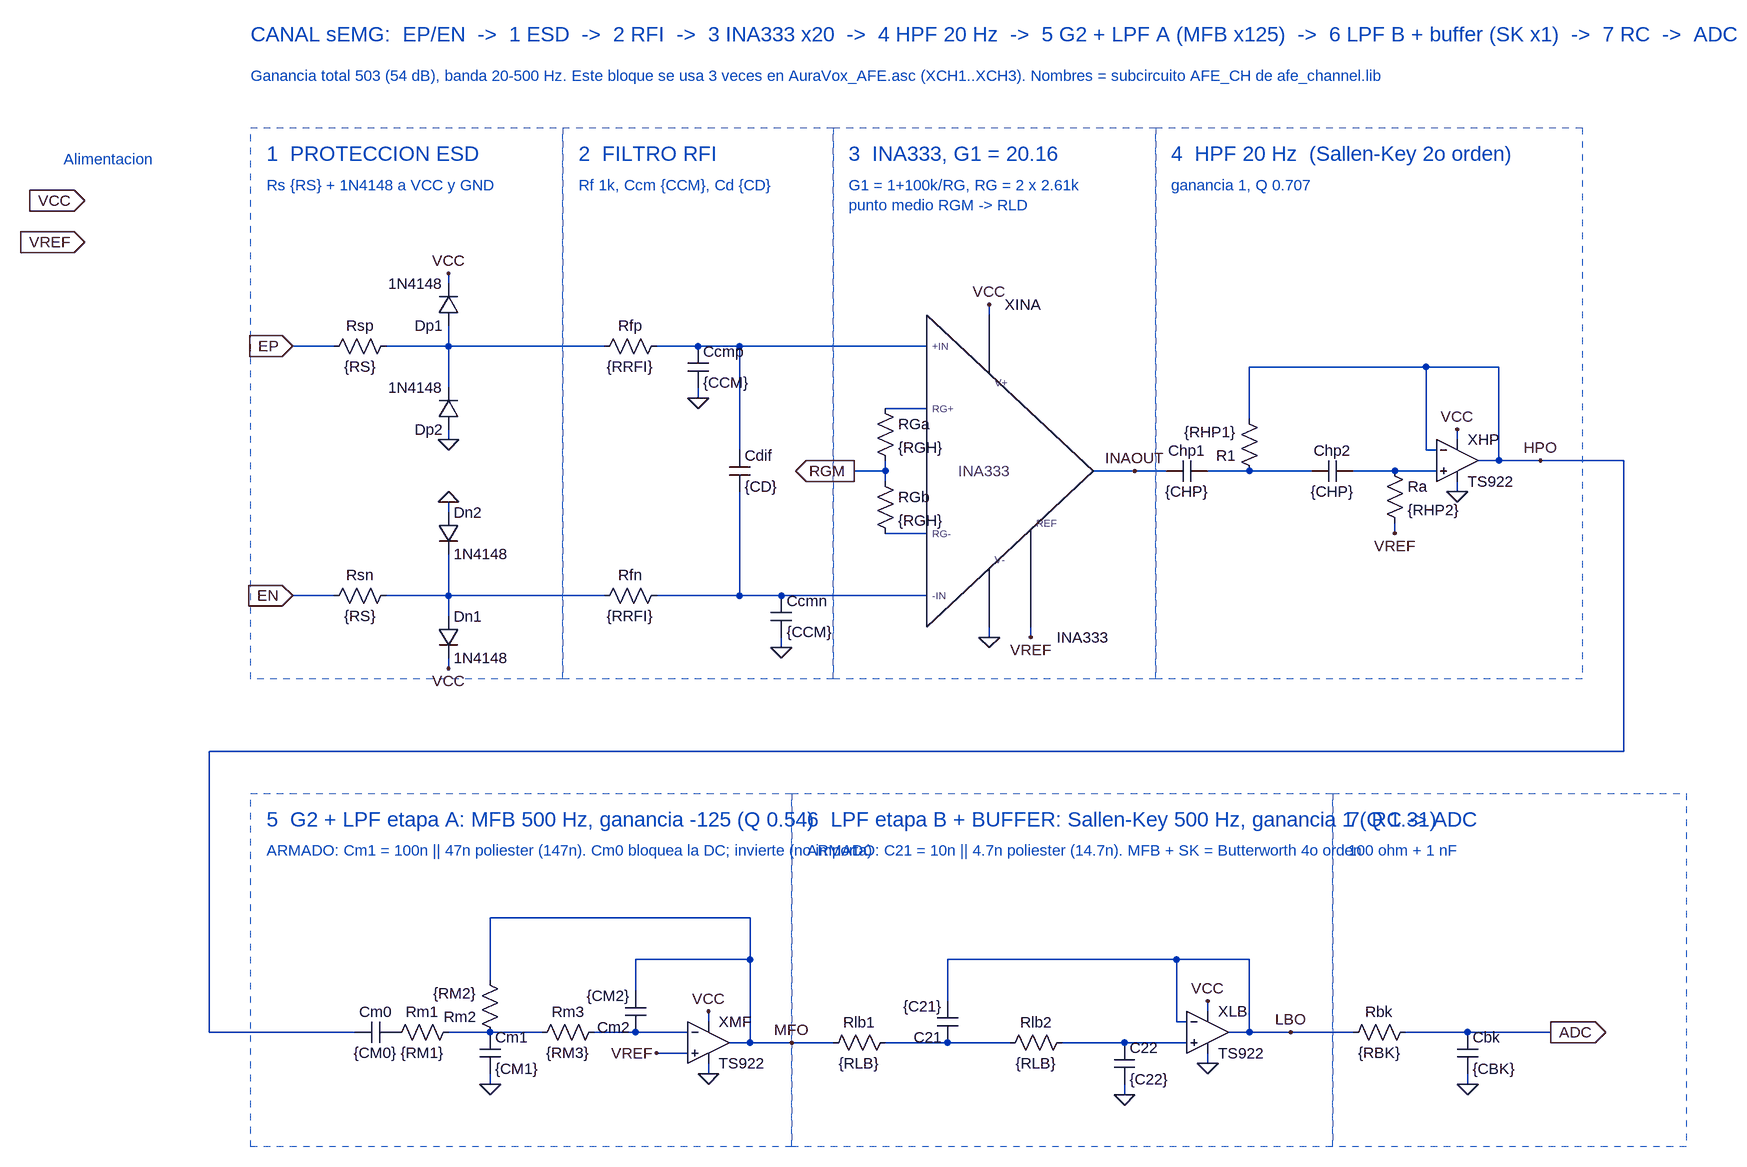
[diagram p0: schematic CANAL.asc]
CANAL.asc, the LTspice schematic file:
Version 4
SHEET 1 3000 1300
WIRE 32 0 -32 0
WIRE 112 0 208 0
WIRE 208 0 448 0
WIRE 32 384 -32 384
WIRE 112 384 208 384
WIRE 208 384 448 384
WIRE 208 0 208 -32
WIRE 208 -96 208 -112
WIRE 208 0 208 64
WIRE 208 128 208 144
WIRE 208 384 208 416
WIRE 208 480 208 496
WIRE 208 320 208 384
WIRE 208 256 208 240
WIRE 528 0 592 0
WIRE 592 0 656 0
WIRE 656 0 720 0
WIRE 720 0 944 0
WIRE 528 384 592 384
WIRE 592 384 656 384
WIRE 656 384 720 384
WIRE 720 384 944 384
WIRE 592 64 592 80
WIRE 656 0 656 160
WIRE 656 224 656 384
WIRE 720 448 720 464
WIRE 944 96 880 96
WIRE 880 176 880 192
WIRE 880 192 880 208
WIRE 880 288 944 288
WIRE 880 192 832 192
WIRE 1040 -48 1040 -64
WIRE 1040 432 1040 448
WIRE 1104 432 1104 448
WIRE 1200 192 1264 192
WIRE 1264 192 1312 192
WIRE 1376 192 1440 192
WIRE 1440 192 1536 192
WIRE 1600 192 1664 192
WIRE 1664 192 1728 192
WIRE 1664 272 1664 288
WIRE 1760 144 1760 128
WIRE 1760 208 1760 224
WIRE 1440 112 1440 32
WIRE 1440 32 1824 32
WIRE 1824 32 1824 176
WIRE 1728 160 1712 160
WIRE 1712 160 1712 32
WIRE 1792 176 1824 176
WIRE 1824 176 1888 176
WIRE 1888 176 2016 176
WIRE 2016 176 2016 624
WIRE 2016 624 -160 624
WIRE -160 624 -160 1056
WIRE -160 1056 64 1056
WIRE 208 1056 272 1056
WIRE 272 1056 352 1056
WIRE 272 1120 272 1136
WIRE 272 976 272 880
WIRE 272 880 672 880
WIRE 432 1056 496 1056
WIRE 496 1056 576 1056
WIRE 496 992 496 944
WIRE 496 944 672 944
WIRE 608 1040 608 1024
WIRE 608 1104 608 1120
WIRE 576 1088 528 1088
WIRE 672 880 672 944
WIRE 672 944 672 1072
WIRE 640 1072 672 1072
WIRE 672 1072 736 1072
WIRE 736 1072 800 1072
WIRE 880 1072 976 1072
WIRE 976 1072 1072 1072
WIRE 1152 1072 1248 1072
WIRE 1248 1072 1344 1072
WIRE 1248 1136 1248 1152
WIRE 1376 1024 1376 1008
WIRE 1376 1088 1376 1104
WIRE 976 1008 976 944
WIRE 976 944 1440 944
WIRE 1440 944 1440 1056
WIRE 1344 1040 1328 1040
WIRE 1328 1040 1328 944
WIRE 1408 1056 1440 1056
WIRE 1440 1056 1504 1056
WIRE 1504 1056 1600 1056
WIRE 1680 1056 1776 1056
WIRE 1776 1056 1904 1056
WIRE 1776 1120 1776 1136
FLAG -352 -224 VCC
IOPIN -352 -224 In
FLAG -352 -160 VREF
IOPIN -352 -160 In
FLAG -32 0 EP
IOPIN -32 0 In
FLAG -32 384 EN
IOPIN -32 384 In
FLAG 208 -112 VCC
FLAG 208 144 0
FLAG 208 496 VCC
FLAG 208 240 0
FLAG 592 80 0
FLAG 720 464 0
FLAG 832 192 RGM
IOPIN 832 192 Out
FLAG 1040 -64 VCC
FLAG 1040 448 0
FLAG 1104 448 VREF
FLAG 1264 192 INAOUT
FLAG 1664 288 VREF
FLAG 1760 128 VCC
FLAG 1760 224 0
FLAG 1888 176 HPO
FLAG 272 1136 0
FLAG 608 1024 VCC
FLAG 608 1120 0
FLAG 528 1088 VREF
FLAG 736 1072 MFO
FLAG 1248 1152 0
FLAG 1376 1008 VCC
FLAG 1376 1104 0
FLAG 1504 1056 LBO
FLAG 1776 1136 0
FLAG 1904 1056 ADC
IOPIN 1904 1056 Out
SYMBOL res 16 16 R270
WINDOW 0 32 56 VTop 2
WINDOW 3 0 56 VBottom 2
SYMATTR InstName Rsp
SYMATTR Value {RS}
SYMBOL res 16 400 R270
WINDOW 0 32 56 VTop 2
WINDOW 3 0 56 VBottom 2
SYMATTR InstName Rsn
SYMATTR Value {RS}
SYMBOL diode 224 -32 R180
SYMATTR InstName Dp1
SYMATTR Value 1N4148
SYMBOL diode 224 128 R180
SYMATTR InstName Dp2
SYMATTR Value 1N4148
SYMBOL diode 192 416 R0
SYMATTR InstName Dn1
SYMATTR Value 1N4148
SYMBOL diode 192 256 R0
SYMATTR InstName Dn2
SYMATTR Value 1N4148
SYMBOL res 432 16 R270
WINDOW 0 32 56 VTop 2
WINDOW 3 0 56 VBottom 2
SYMATTR InstName Rfp
SYMATTR Value {RRFI}
SYMBOL res 432 400 R270
WINDOW 0 32 56 VTop 2
WINDOW 3 0 56 VBottom 2
SYMATTR InstName Rfn
SYMATTR Value {RRFI}
SYMBOL cap 576 0 R0
SYMATTR InstName Ccmp
SYMATTR Value {CCM}
SYMBOL cap 640 160 R0
SYMATTR InstName Cdif
SYMATTR Value {CD}
SYMBOL cap 704 384 R0
SYMATTR InstName Ccmn
SYMATTR Value {CCM}
SYMBOL INA333 1040 192 R0
SYMATTR InstName XINA
SYMATTR Value INA333
SYMBOL res 864 80 R0
SYMATTR InstName RGa
SYMATTR Value {RGH}
SYMBOL res 864 192 R0
SYMATTR InstName RGb
SYMATTR Value {RGH}
SYMBOL cap 1312 208 R270
WINDOW 0 32 32 VTop 2
WINDOW 3 0 32 VBottom 2
SYMATTR InstName Chp1
SYMATTR Value {CHP}
SYMBOL res 1456 208 R180
SYMATTR InstName R1
SYMATTR Value {RHP1}
SYMBOL cap 1536 208 R270
WINDOW 0 32 32 VTop 2
WINDOW 3 0 32 VBottom 2
SYMATTR InstName Chp2
SYMATTR Value {CHP}
SYMBOL res 1648 176 R0
SYMATTR InstName Ra
SYMATTR Value {RHP2}
SYMBOL OpAmps\\opamp2 1760 112 R0
SYMATTR InstName XHP
SYMATTR Value TS922
SYMBOL cap 64 1072 R270
WINDOW 0 32 32 VTop 2
WINDOW 3 0 32 VBottom 2
SYMATTR InstName Cm0
SYMATTR Value {CM0}
SYMBOL res 112 1072 R270
WINDOW 0 32 56 VTop 2
WINDOW 3 0 56 VBottom 2
SYMATTR InstName Rm1
SYMATTR Value {RM1}
SYMBOL cap 256 1056 R0
SYMATTR InstName Cm1
SYMATTR Value {CM1}
SYMBOL res 288 1072 R180
SYMATTR InstName Rm2
SYMATTR Value {RM2}
SYMBOL res 336 1072 R270
WINDOW 0 32 56 VTop 2
WINDOW 3 0 56 VBottom 2
SYMATTR InstName Rm3
SYMATTR Value {RM3}
SYMBOL cap 512 1056 R180
SYMATTR InstName Cm2
SYMATTR Value {CM2}
SYMBOL OpAmps\\opamp2 608 1008 R0
SYMATTR InstName XMF
SYMATTR Value TS922
SYMBOL res 784 1088 R270
WINDOW 0 32 56 VTop 2
WINDOW 3 0 56 VBottom 2
SYMATTR InstName Rlb1
SYMATTR Value {RLB}
SYMBOL cap 992 1072 R180
SYMATTR InstName C21
SYMATTR Value {C21}
SYMBOL res 1056 1088 R270
WINDOW 0 32 56 VTop 2
WINDOW 3 0 56 VBottom 2
SYMATTR InstName Rlb2
SYMATTR Value {RLB}
SYMBOL cap 1232 1072 R0
SYMATTR InstName C22
SYMATTR Value {C22}
SYMBOL OpAmps\\opamp2 1376 992 R0
SYMATTR InstName XLB
SYMATTR Value TS922
SYMBOL res 1584 1072 R270
WINDOW 0 32 56 VTop 2
WINDOW 3 0 56 VBottom 2
SYMATTR InstName Rbk
SYMATTR Value {RBK}
SYMBOL cap 1760 1056 R0
SYMATTR InstName Cbk
SYMATTR Value {CBK}
TEXT -96 -480 Left 3 ;CANAL sEMG:  EP/EN  ->  1 ESD  ->  2 RFI  ->  3 INA333 x20  ->  4 HPF 20 Hz  ->  5 G2 + LPF A (MFB x125)  ->  6 LPF B + buffer (SK x1)  ->  7 RC  ->  ADC
TEXT -96 -416 Left 2 ;Ganancia total 503 (54 dB), banda 20-500 Hz. Este bloque se usa 3 veces en AuraVox_AFE.asc (XCH1..XCH3). Nombres = subcircuito AFE_CH de afe_channel.lib
TEXT -384 -288 Left 2 ;Alimentacion
RECTANGLE Normal -96 -336 384 512 2
TEXT -72 -296 Left 3 ;1  PROTECCION ESD
TEXT -72 -248 Left 2 ;Rs {RS} + 1N4148 a VCC y GND
RECTANGLE Normal 384 -336 800 512 2
TEXT 408 -296 Left 3 ;2  FILTRO RFI
TEXT 408 -248 Left 2 ;Rf 1k, Ccm {CCM}, Cd {CD}
RECTANGLE Normal 800 -336 1296 512 2
TEXT 824 -296 Left 3 ;3  INA333, G1 = 20.16
TEXT 824 -248 Left 2 ;G1 = 1+100k/RG, RG = 2 x 2.61k\npunto medio RGM -> RLD
RECTANGLE Normal 1296 -336 1952 512 2
TEXT 1320 -296 Left 3 ;4  HPF 20 Hz  (Sallen-Key 2o orden)
TEXT 1320 -248 Left 2 ;ganancia 1, Q 0.707
RECTANGLE Normal -96 688 736 1232 2
TEXT -72 728 Left 3 ;5  G2 + LPF etapa A: MFB 500 Hz, ganancia -125 (Q 0.54)
TEXT -72 776 Left 2 ;ARMADO: Cm1 = 100n || 47n poliester (147n). Cm0 bloquea la DC; invierte (no importa)
RECTANGLE Normal 736 688 1568 1232 2
TEXT 760 728 Left 3 ;6  LPF etapa B + BUFFER: Sallen-Key 500 Hz, ganancia 1 (Q 1.31)
TEXT 760 776 Left 2 ;ARMADO: C21 = 10n || 4.7n poliester (14.7n). MFB + SK = Butterworth 4o orden
RECTANGLE Normal 1568 688 2112 1232 2
TEXT 1592 728 Left 3 ;7  RC -> ADC
TEXT 1592 776 Left 2 ;100 ohm + 1 nF

The netlist it stands for:
* CANAL.asc
Rsp EP N001 {RS}
Rsn EN N002 {RS}
Dp1 N001 VCC 1N4148
Dp2 0 N001 1N4148
Dn1 N002 VCC 1N4148
Dn2 0 N002 1N4148
Rfp N001 N003 {RRFI}
Rfn N002 N004 {RRFI}
Ccmp N003 0 {CCM}
Cdif N003 N004 {CD}
Ccmn N004 0 {CCM}
XXINA N003 N004 VCC 0 INAOUT VREF N005 N006 INA333  ; pins IN+ IN- VCC VEE OUT REF RG+ RG-
RGa N005 RGM {RGH}
RGb RGM N006 {RGH}
Chp1 INAOUT N007 {CHP}
R1 N007 HPO {RHP1}
Chp2 N007 N008 {CHP}
Ra N008 VREF {RHP2}
XXHP N008 HPO VCC 0 HPO TS922  ; pins In+ In- V+ V- OUT
Cm0 HPO P001 {CM0}
Rm1 P001 N009 {RM1}
Cm1 N009 0 {CM1}
Rm2 N009 MFO {RM2}
Rm3 N009 N010 {RM3}
Cm2 N010 MFO {CM2}
XXMF VREF N010 VCC 0 MFO TS922  ; pins In+ In- V+ V- OUT
Rlb1 MFO N011 {RLB}
C21 N011 LBO {C21}
Rlb2 N011 N012 {RLB}
C22 N012 0 {C22}
XXLB N012 LBO VCC 0 LBO TS922  ; pins In+ In- V+ V- OUT
Rbk LBO ADC {RBK}
Cbk ADC 0 {CBK}
.model D D
.lib standard.dio
* CANAL sEMG:  EP/EN  ->  1 ESD  ->  2 RFI  ->  3 INA333 x20  ->  4 HPF 20 Hz  ->  5 G2 + LPF A (MFB x125)  ->  6 LPF B + buffer (SK x1)  ->  7 RC  ->  ADC
* Ganancia total 503 (54 dB), banda 20-500 Hz. Este bloque se usa 3 veces en AuraVox_AFE.asc (XCH1..XCH3). Nombres = subcircuito AFE_CH de afe_channel.lib
* Alimentacion
* 1  PROTECCION ESD
* Rs {RS} + 1N4148 a VCC y GND
* 2  FILTRO RFI
* Rf 1k, Ccm {CCM}, Cd {CD}
* 3  INA333, G1 = 20.16
* G1 = 1+100k/RG, RG = 2 x 2.61k
* punto medio RGM -> RLD
* 4  HPF 20 Hz  (Sallen-Key 2o orden)
* ganancia 1, Q 0.707
* 5  G2 + LPF etapa A: MFB 500 Hz, ganancia -125 (Q 0.54)
* ARMADO: Cm1 = 100n || 47n poliester (147n). Cm0 bloquea la DC; invierte (no importa)
* 6  LPF etapa B + BUFFER: Sallen-Key 500 Hz, ganancia 1 (Q 1.31)
* ARMADO: C21 = 10n || 4.7n poliester (14.7n). MFB + SK = Butterworth 4o orden
* 7  RC -> ADC
* 100 ohm + 1 nF
.backanno
.end